# Altium schematic sheet main.SchDoc
size A4; SheetNumber: 1; SheetTotal: 3
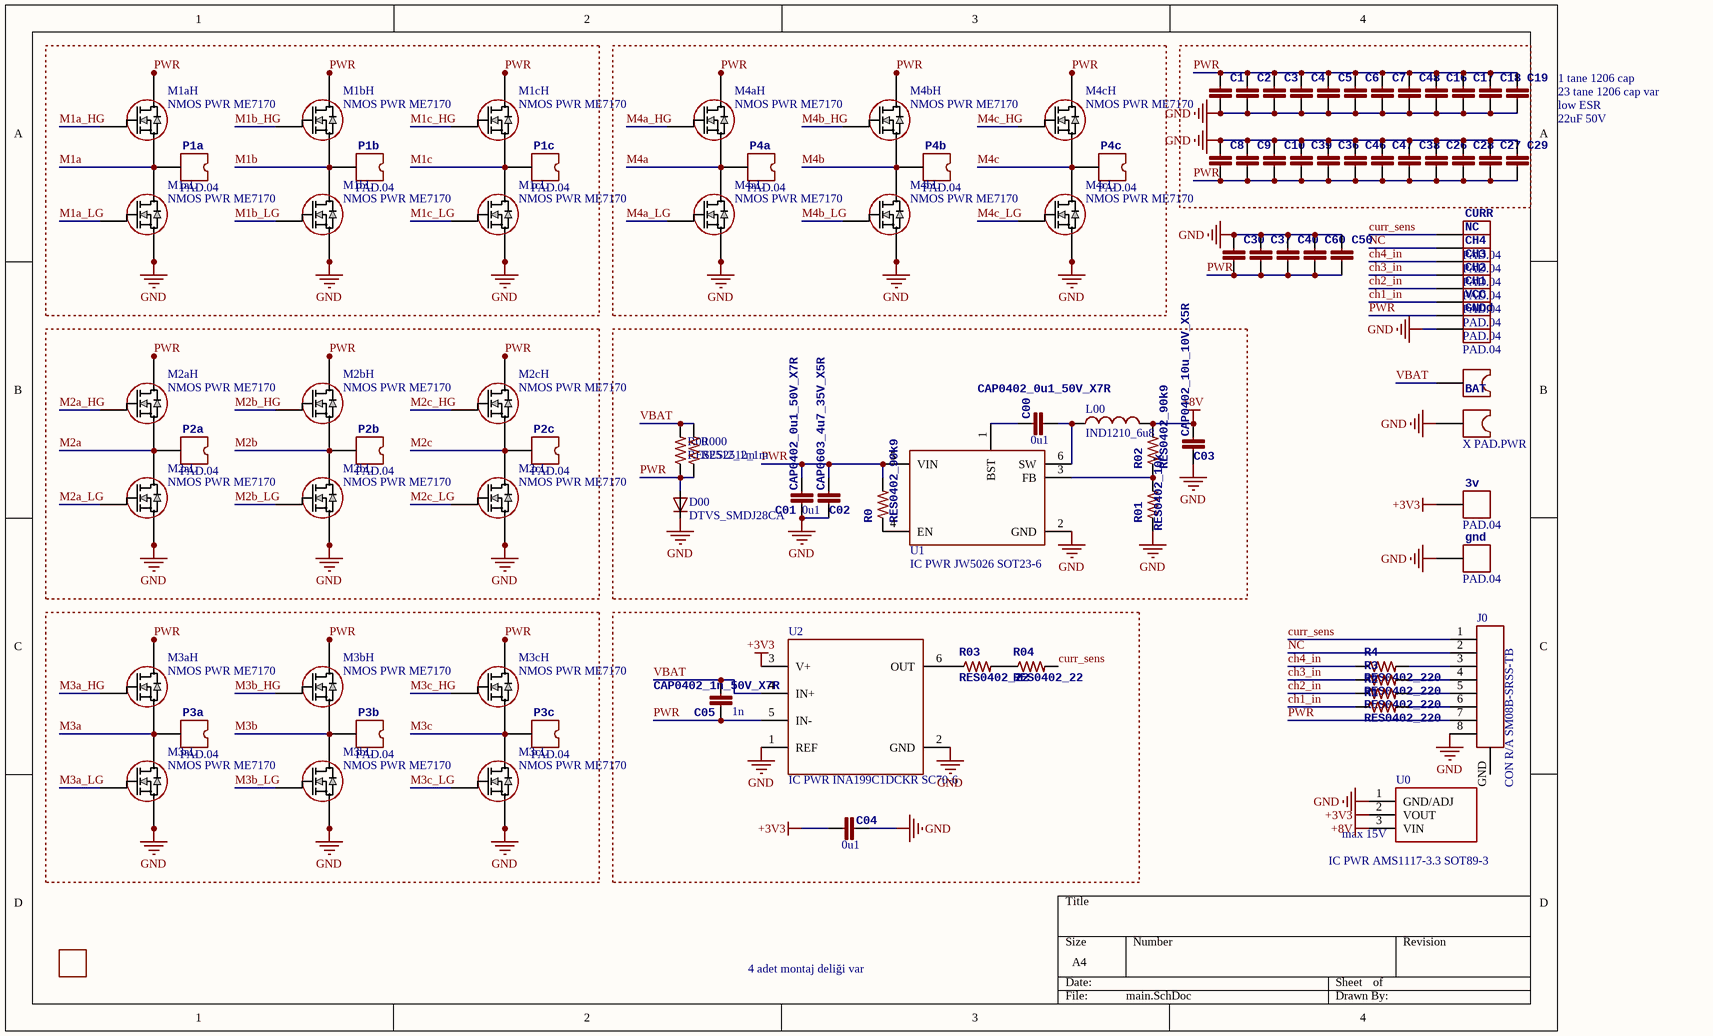
[diagram p0: main.SchDoc]

## Parts
3v  PAD.04  [PAD.04X.04]  (no BOM)
BAT  X PAD.PWR  [PAD6x8]  (no BOM)
C00  CAP0402_0u1_50V_X7R  value 0u1  [0402-CAP]
C1  CAP1206_22u_35V_X5R  [1206-CAP]  (value not drawn)
C01  CAP0402_0u1_50V_X7R  value 0u1  [0402-CAP]
C2  CAP1206_22u_35V_X5R  [1206-CAP]  (value not drawn)
C02  CAP0603_4u7_35V_X5R  [0603-CAP]
C3  CAP1206_22u_35V_X5R  [1206-CAP]  (value not drawn)
C03  CAP0402_10u_10V_X5R  [0402-CAP]
C4  CAP1206_22u_35V_X5R  [1206-CAP]  (value not drawn)
C04  value 0u1  [0402-CAP]  (hidden comment: CAP0402_0u1_16V_X7R)
C5  CAP1206_22u_35V_X5R  [1206-CAP]  (value not drawn)
C05  CAP0402_1n_50V_X7R  value 1n  [0402-CAP]
C6  CAP1206_22u_35V_X5R  [1206-CAP]  (value not drawn)
C7  CAP1206_22u_35V_X5R  [1206-CAP]  (value not drawn)
C8  CAP1206_22u_35V_X5R  [1206-CAP]  (value not drawn)
C9  CAP1206_22u_35V_X5R  [1206-CAP]  (value not drawn)
C10  CAP1206_22u_35V_X5R  [1206-CAP]  (value not drawn)
C16  CAP1206_22u_35V_X5R  [1206-CAP]  (value not drawn)
C17  CAP1206_22u_35V_X5R  [1206-CAP]  (value not drawn)
C18  CAP1206_22u_35V_X5R  [1206-CAP]  (value not drawn)
C19  CAP1206_22u_35V_X5R  [1206-CAP]  (value not drawn)
C26  CAP1206_22u_35V_X5R  [1206-CAP]  (value not drawn)
C27  CAP1206_22u_35V_X5R  [1206-CAP]  (value not drawn)
C28  CAP1206_22u_35V_X5R  [1206-CAP]  (value not drawn)
C29  CAP1206_22u_35V_X5R  [1206-CAP]  (value not drawn)
C30  CAP1206_22u_35V_X5R  [1206-CAP]  (value not drawn)
C36  CAP1206_22u_35V_X5R  [1206-CAP]  (value not drawn)
C37  CAP1206_22u_35V_X5R  [1206-CAP]  (value not drawn)
C38  CAP1206_22u_35V_X5R  [1206-CAP]  (value not drawn)
C39  CAP1206_22u_35V_X5R  [1206-CAP]  (value not drawn)
C40  CAP1206_22u_35V_X5R  [1206-CAP]  (value not drawn)
C46  CAP1206_22u_35V_X5R  [1206-CAP]  (value not drawn)
C47  CAP1206_22u_35V_X5R  [1206-CAP]  (value not drawn)
C48  CAP1206_22u_35V_X5R  [1206-CAP]  (value not drawn)
C50  CAP1206_22u_35V_X5R  [1206-CAP]  (value not drawn)
C60  CAP1206_22u_35V_X5R  [1206-CAP]  (value not drawn)
CH1  PAD.04  [PAD.04X.04]  (no BOM)
CH2  PAD.04  [PAD.04X.04]  (no BOM)
CH3  PAD.04  [PAD.04X.04]  (no BOM)
CH4  PAD.04  [PAD.04X.04]  (no BOM)
CURR  PAD.04  [PAD.04X.04]  (no BOM)
D00  DTVS_SMDJ28CA  [SMC-TVS]
gnd  PAD.04  [PAD.04X.04]  (no BOM)
GNDd  PAD.04  [PAD.04X.04]  (no BOM)
J0  CON R/A SM08B-SRSS-TB  [JST_SM08B-SRSS-TB]
L00  IND1210_6u8  [1210-IND]
LOGO  00 LOGO FTECH  [00FTECH]  (value not drawn)  (no BOM)
M1aH  NMOS PWR ME7170  [8DFN4.9X5.8]
M1aL  NMOS PWR ME7170  [8DFN4.9X5.8]
M1bH  NMOS PWR ME7170  [8DFN4.9X5.8]
M1bL  NMOS PWR ME7170  [8DFN4.9X5.8]
M1cH  NMOS PWR ME7170  [8DFN4.9X5.8]
M1cL  NMOS PWR ME7170  [8DFN4.9X5.8]
M2aH  NMOS PWR ME7170  [8DFN4.9X5.8]
M2aL  NMOS PWR ME7170  [8DFN4.9X5.8]
M2bH  NMOS PWR ME7170  [8DFN4.9X5.8]
M2bL  NMOS PWR ME7170  [8DFN4.9X5.8]
M2cH  NMOS PWR ME7170  [8DFN4.9X5.8]
M2cL  NMOS PWR ME7170  [8DFN4.9X5.8]
M3aH  NMOS PWR ME7170  [8DFN4.9X5.8]
M3aL  NMOS PWR ME7170  [8DFN4.9X5.8]
M3bH  NMOS PWR ME7170  [8DFN4.9X5.8]
M3bL  NMOS PWR ME7170  [8DFN4.9X5.8]
M3cH  NMOS PWR ME7170  [8DFN4.9X5.8]
M3cL  NMOS PWR ME7170  [8DFN4.9X5.8]
M4aH  NMOS PWR ME7170  [8DFN4.9X5.8]
M4aL  NMOS PWR ME7170  [8DFN4.9X5.8]
M4bH  NMOS PWR ME7170  [8DFN4.9X5.8]
M4bL  NMOS PWR ME7170  [8DFN4.9X5.8]
M4cH  NMOS PWR ME7170  [8DFN4.9X5.8]
M4cL  NMOS PWR ME7170  [8DFN4.9X5.8]
NC  PAD.04  [PAD.04X.04]  (no BOM)
P1a  PAD.04  [PAD3.2x3.2]  (no BOM)
P1b  PAD.04  [PAD3.2x3.2]  (no BOM)
P1c  PAD.04  [PAD3.2x3.2]  (no BOM)
P2a  PAD.04  [PAD3.2x3.2]  (no BOM)
P2b  PAD.04  [PAD3.2x3.2]  (no BOM)
P2c  PAD.04  [PAD3.2x3.2]  (no BOM)
P3a  PAD.04  [PAD3.2x3.2]  (no BOM)
P3b  PAD.04  [PAD3.2x3.2]  (no BOM)
P3c  PAD.04  [PAD3.2x3.2]  (no BOM)
P4a  PAD.04  [PAD3.2x3.2]  (no BOM)
P4b  PAD.04  [PAD3.2x3.2]  (no BOM)
P4c  PAD.04  [PAD3.2x3.2]  (no BOM)
R00  RES2512_1m  [2512-RES]
R0  RES0402_90k9  [0402-RES]
R000  RES2512_1m  [2512-RES]
R01  RES0402_10k  [0402-RES]
R1  RES0402_220  [0402-RES]
R2  RES0402_220  [0402-RES]
R02  RES0402_90k9  [0402-RES]
R3  RES0402_220  [0402-RES]
R03  RES0402_22  [0402-RES]
R4  RES0402_220  [0402-RES]
R04  RES0402_22  [0402-RES]
U0  IC PWR AMS1117-3.3 SOT89-3  [SOT89-3]
U1  IC PWR JW5026 SOT23-6  [SOT23-6]
U2  IC PWR INA199C1DCKR SC70-6  [SC70-6]
VCC  PAD.04  [PAD.04X.04]  (no BOM)

## Nets
+3V3: 3v.P$1 C04.P$1 U0.2(VOUT) U2.3(V+)
+8V: C03.P$1 L00.2 R02.P$2 U0.3(VIN)
GND: BAT.P$2 C1.P$2 C01.P$2 C2.P$2 C02.P$2 C3.P$2 C03.P$2 C4.P$2 C04.P$2 C5.P$2 C6.P$2 C7.P$2 C8.P$1 C9.P$1 C10.P$1 C16.P$2 C17.P$2 C18.P$2 C19.P$2 C26.P$1 C27.P$1 C28.P$1 C29.P$1 C30.P$1 C36.P$1 C37.P$1 C38.P$1 C39.P$1 C40.P$1 C46.P$1 C47.P$1 C48.P$2 C50.P$1 C60.P$1 D00.C gnd.P$1 GNDd.P$1 J0.8 M1aL.1 M1aL.2 M1aL.3 M1bL.1 M1bL.2 M1bL.3 M1cL.1 M1cL.2 M1cL.3 M2aL.1 M2aL.2 M2aL.3 M2bL.1 M2bL.2 M2bL.3 M2cL.1 M2cL.2 M2cL.3 M3aL.1 M3aL.2 M3aL.3 M3bL.1 M3bL.2 M3bL.3 M3cL.1 M3cL.2 M3cL.3 M4aL.1 M4aL.2 M4aL.3 M4bL.1 M4bL.2 M4bL.3 M4cL.1 M4cL.2 M4cL.3 R01.P$1 U0.1(GND/ADJ) U1.2(GND) U2.1(REF) U2.2(GND)
ch1_in: CH1.P$1 R1.P$1
ch2_in: CH2.P$1 R2.P$1
ch3_in: CH3.P$1 R3.P$1
ch4_in: CH4.P$1 R4.P$1
curr_sens: CURR.P$1 J0.1 R04.P$2
M1a: M1aH.1 M1aH.2 M1aH.3 M1aL.5 M1aL.6 M1aL.7 M1aL.8 P1a.P$1
M1a_HG: M1aH.4
M1a_LG: M1aL.4
M1b: M1bH.1 M1bH.2 M1bH.3 M1bL.5 M1bL.6 M1bL.7 M1bL.8 P1b.P$1
M1b_HG: M1bH.4
M1b_LG: M1bL.4
M1c: M1cH.1 M1cH.2 M1cH.3 M1cL.5 M1cL.6 M1cL.7 M1cL.8 P1c.P$1
M1c_HG: M1cH.4
M1c_LG: M1cL.4
M2a: M2aH.1 M2aH.2 M2aH.3 M2aL.5 M2aL.6 M2aL.7 M2aL.8 P2a.P$1
M2a_HG: M2aH.4
M2a_LG: M2aL.4
M2b: M2bH.1 M2bH.2 M2bH.3 M2bL.5 M2bL.6 M2bL.7 M2bL.8 P2b.P$1
M2b_HG: M2bH.4
M2b_LG: M2bL.4
M2c: M2cH.1 M2cH.2 M2cH.3 M2cL.5 M2cL.6 M2cL.7 M2cL.8 P2c.P$1
M2c_HG: M2cH.4
M2c_LG: M2cL.4
M3a: M3aH.1 M3aH.2 M3aH.3 M3aL.5 M3aL.6 M3aL.7 M3aL.8 P3a.P$1
M3a_HG: M3aH.4
M3a_LG: M3aL.4
M3b: M3bH.1 M3bH.2 M3bH.3 M3bL.5 M3bL.6 M3bL.7 M3bL.8 P3b.P$1
M3b_HG: M3bH.4
M3b_LG: M3bL.4
M3c: M3cH.1 M3cH.2 M3cH.3 M3cL.5 M3cL.6 M3cL.7 M3cL.8 P3c.P$1
M3c_HG: M3cH.4
M3c_LG: M3cL.4
M4a: M4aH.1 M4aH.2 M4aH.3 M4aL.5 M4aL.6 M4aL.7 M4aL.8 P4a.P$1
M4a_HG: M4aH.4
M4a_LG: M4aL.4
M4b: M4bH.1 M4bH.2 M4bH.3 M4bL.5 M4bL.6 M4bL.7 M4bL.8 P4b.P$1
M4b_HG: M4bH.4
M4b_LG: M4bL.4
M4c: M4cH.1 M4cH.2 M4cH.3 M4cL.5 M4cL.6 M4cL.7 M4cL.8 P4c.P$1
M4c_HG: M4cH.4
M4c_LG: M4cL.4
NC: J0.2 NC.P$1
PWR: C1.P$1 C01.P$1 C2.P$1 C02.P$1 C3.P$1 C4.P$1 C5.P$1 C05.P$2 C6.P$1 C7.P$1 C8.P$2 C9.P$2 C10.P$2 C16.P$1 C17.P$1 C18.P$1 C19.P$1 C26.P$2 C27.P$2 C28.P$2 C29.P$2 C30.P$2 C36.P$2 C37.P$2 C38.P$2 C39.P$2 C40.P$2 C46.P$2 C47.P$2 C48.P$1 C50.P$2 C60.P$2 D00.A J0.7 M1aH.5 M1aH.6 M1aH.7 M1aH.8 M1bH.5 M1bH.6 M1bH.7 M1bH.8 M1cH.5 M1cH.6 M1cH.7 M1cH.8 M2aH.5 M2aH.6 M2aH.7 M2aH.8 M2bH.5 M2bH.6 M2bH.7 M2bH.8 M2cH.5 M2cH.6 M2cH.7 M2cH.8 M3aH.5 M3aH.6 M3aH.7 M3aH.8 M3bH.5 M3bH.6 M3bH.7 M3bH.8 M3cH.5 M3cH.6 M3cH.7 M3cH.8 M4aH.5 M4aH.6 M4aH.7 M4aH.8 M4bH.5 M4bH.6 M4bH.7 M4bH.8 M4cH.5 M4cH.6 M4cH.7 M4cH.8 R00.P$1 R000.P$1 R0.P$2 U1.5(VIN) U2.5(IN-) VCC.P$1
VBAT: BAT.P$1 C05.P$1 R00.P$2 R000.P$2 U2.4(IN+)
NetC00_P$1: C00.P$1 L00.1 U1.6(SW)
NetC00_P$2: C00.P$2 U1.1(BST)
NetJ0_3: J0.3 R4.P$2
NetJ0_4: J0.4 R3.P$2
NetJ0_5: J0.5 R2.P$2
NetJ0_6: J0.6 R1.P$2
NetR0_P$1: R0.P$1 U1.4(EN)
NetR01_P$2: R01.P$2 R02.P$1 U1.3(FB)
NetR03_P$1: R03.P$1 U2.6(OUT)
NetR03_P$2: R03.P$2 R04.P$1

Not connected (* = marked no-connect by the designer): J0 GND

## Notes on the sheet
- (near C19) 23 tane 1206 cap var
- (near C19) 1 tane 1206 cap
- low ESR
- 22uF 50V
- (near U0) max 15V
- 4 adet montaj deliği var

## Library data of the parts
3v CH1-CH4 CURR gnd GNDd NC VCC = X PADS.04
C00 C01 = CAP0402_0u1_50V_X7R: 50V 100nF X7R ±10% 0402 Multilayer Ceramic Capacitors MLCC - SMD/SMT ROHS; Manufacturer Product Number: GRM155R71H104KE14D; LSCS Part Number: C77020; Voltage Rating: 50; Package: 0402; Digikey Part Number: 490-10700-1-ND
C1-C10 C16-C19 C26-C30 C36-C40 C46-C48 C50 C60 = CAP1206_22u_35V_X5R: CAP CER 22UF 35V 20% X5R 1206; Manufacturer Product Number: C3216X5R1V226M160AC; LSCS Part Number: C342620; Voltage Rating: 35; Value: 22uF; Digikey Part Number: 445-8045-1-ND; Package: 1206
C02 = CAP0603_4u7_35V_X5R: 35V 4.7uF X5R ±10% 0603 Multilayer Ceramic Capacitors MLCC - SMD/SMT ROHS; Manufacturer Product Number: GRM188R6YA475KE15D; LSCS Part Number: C162274; Value: 4.7u; Package: 0603; Voltage Rating: 35V; Digikey Part Number: 490-7205-1-ND
C03 = CAP0402_10u_10V_X5R: 10V 10uF X5R ±20% 0402 Multilayer Ceramic Capacitors MLCC - SMD/SMT ROHS; Manufacturer Product Number: GRM155R61A106ME44D; LSCS Part Number: C77000; Value: 10u; Package: 0402; Voltage Rating: 10V; Digikey Part Number: N/A
C04 = CAP0402_0u1_16V_X7R: X7R 100nF 16V ±10% 0402 Multilayer Ceramic Capacitors MLCC - SMD/SMT ROHS; Manufacturer Product Number: CL05B104KO3LNNC; LSCS Part Number: C1525; Voltage Rating: 16; Digikey Part Number: 1276-1507-1-ND; Package: 0402
C05 = CAP0402_1n_50V_X7R: 50V 1nF X7R ±10% 0402 Multilayer Ceramic Capacitors MLCC - SMD/SMT ROHS; Manufacturer Product Number: CC0402KRX7R9BB102; LSCS Part Number: C106205; Voltage Rating: 50; Package: 0402; Digikey Part Number: 311-1036-1-ND
D00 = DTVS_SMDJ28CA: 66.1A 45.4V 3kW 31.1V 28V SMC ESD and Surge Protection (TVS/ESD) ROHS; LSCS Part Number: C2990249; Digikey Part Number: SMDJ28CACT-ND; Manufacturer Product Number: SMDJ28CA; Package: SMC, DO214AB
J0 = CON R/A SM08B-SRSS-TB: SH Series 8 Position 1 mm Pitch Surface Mount Side Entry Shrouded Header Right Angle / CONN HEADER SMD R/A 8POS 1MM; LSCS Part Number: C2763618; Manufacturer Product Number: SM08B-SRSS-TB; Digikey Part Number: 455-1808-1-ND
L00 = IND1210_6u8: 1.6A 6.8uH ±20% 1.8A 220mΩ 1210 Inductors (SMD) ROHS; Manufacturer Product Number: TFM322512ALMA6R8MTAA; LSCS Part Number: C2047644; Package: 1210; Value: 6.8uH; Digikey Part Number: 445-TFM322512ALMA6R8MTAACT-ND
M1aH M1aL M1bH M1bL M1cH M1cL M2aH M2aL M2bH M2bL M2cH M2cL M3aH M3aL M3bH M3bL M3cH M3cL M4aH M4aL M4bH M4bL M4cH M4cL = NMOS PWR ME7170: 30V 90A NMOS 3.9mΩ@4.5V,19A 36W 2.2V DFN-8(4.9x5.8) MOSFETs ROHS; LSCS Part Number: C2841360; Manufacturer Product Number: ME7170; Package: 8DFN(4.9x5.8); Digikey Part Number: N/A
P1a P1b P1c P2a P2b P2c P3a P3b P3c P4a P4b P4c = X PAD.ESC
R00 R000 = RES2512_1m: 2W 1mΩ Current Sensing Resistors ±50ppm/℃ ±1% 2512 Current Sense Resistors / Shunt Resistors ROHS; Manufacturer Product Number: PA2512FKE7W0R001E; LSCS Part Number: C326570; Value: 1m; Digikey Part Number: YAG6089CT-ND; Package: 2512
R0 R02 = RES0402_90k9: 62.5mW Thick Film Resistors 50V ±100ppm/℃ ±1% 90.9kΩ 0402 Chip Resistor - Surface Mount ROHS; Manufacturer Product Number: RC0402FR-0790K9L; LSCS Part Number: C163452; Value: 90.9k; Package: 0402; Digikey Part Number: 311-90.9KLRCT-ND
R01 = RES0402_10k: 50V Thick Film Resistors 62.5mW 110kΩ ±1% ±100ppm/℃ 0402 Chip Resistor - Surface Mount ROHS; Manufacturer Product Number: RC0402FR-0710KL; LSCS Part Number: C60490; Value: 10k; Package: 0402; Digikey Part Number: 311-10.0KLRCT-ND
R1-R4 = RES0402_220: 62.5mW Thick Film Resistors 50V ±100ppm/℃ ±1% 220Ω 0402 Chip Resistor - Surface Mount ROHS; Manufacturer Product Number: RC0402FR-07220RL; LSCS Part Number: C112291; Value: 220; Package: 0402; Digikey Part Number: 311-220LRCT-ND
R03 R04 = RES0402_22: 62.5mW Thick Film Resistors 50V ±1% ±100ppm/℃ 22Ω 0402 Chip Resistor - Surface Mount ROHS; Manufacturer Product Number: RC0402FR-0722RL; LSCS Part Number: C114765; Value: 22; Package: 0402; Digikey Part Number: 311-22.0LRCT-ND
U0 = IC PWR AMS1117-3.3 SOT89-3: IC LDO REG 3.3V 1A 15Vinmax SOT89-3; LSCS Part Number: C22472154; Voltage Rating: 15V; Manufacturer Product Number: AMS1117-3.3; Package: SOT89-3; Digikey Part Number: 5272-AMS1117-3.3SCT-ND; Output Voltage: 3.3V; Output Current: 1A
U1 = IC PWR JW5026 SOT23-6: Step-down type 1A 4.7V~40V SOT-23-6 DC-DC Converters ROHS; LSCS Part Number: C185109; Manufacturer Product Number: JW5026; Package: SOT23-6; Digikey Part Number: N/A
U2 = IC PWR INA199C1DCKR SC70-6: Current Sense Regulator High/Low-Side SC-70-6; LSCS Part Number: C2155860; Manufacturer Product Number: INA199C1DCKR; Package: SC70-6; Digikey Part Number: 296-47775-1-ND